# EasyEDA Pro project CirculationPumpSmartControl.eprj

# Schematic Schematic1

## Sheets
1 ESP32: Board Name: Board1; Create Date: 2025-01-20; Page Name: ESP32; Project Name: CirculationPumpSmartControl; Schematic Name: Schematic1; Update Date: 2025-02-27; Company: EasyEDA.com; Page Size: A4; Version: V1.0
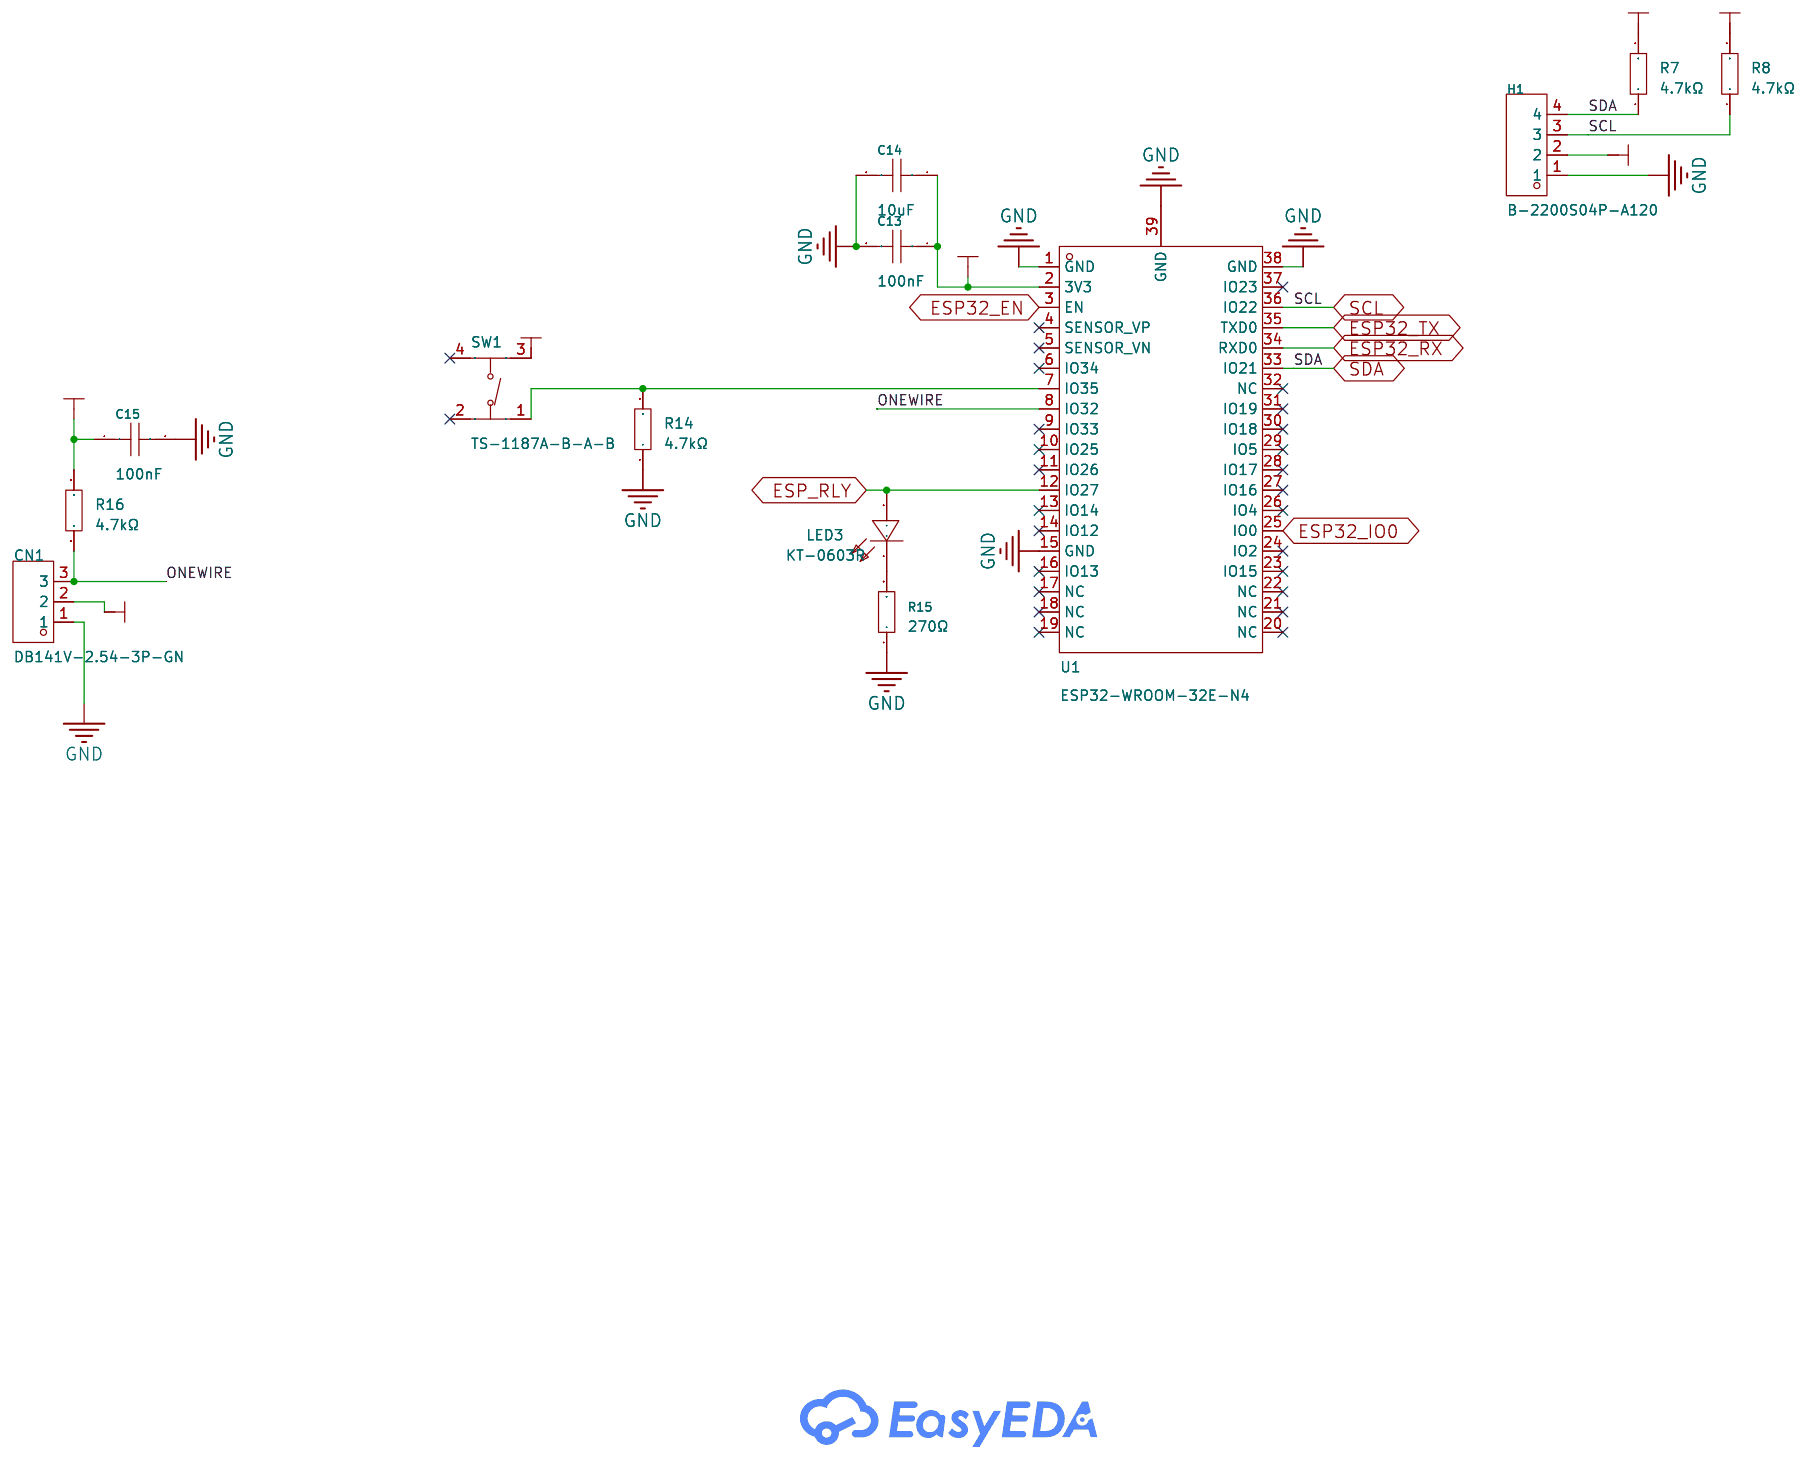
[diagram p0: ESP32]
2 Power: Page Name: Power
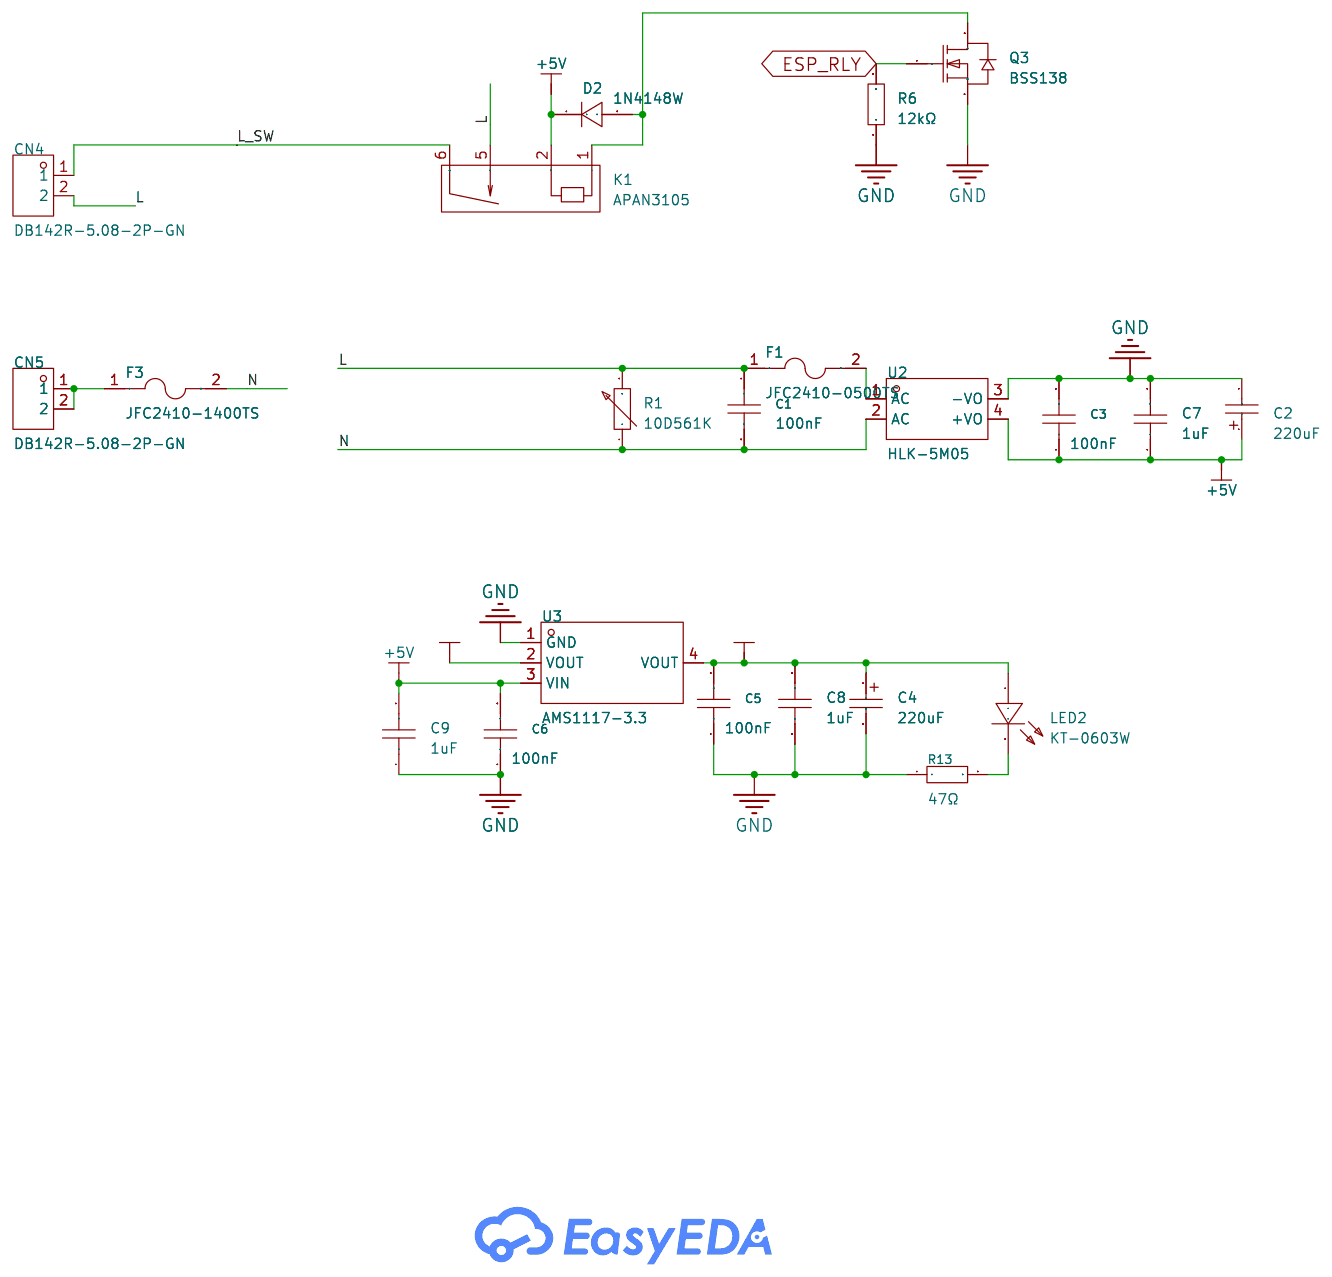
[diagram p1: Power]
3 USB: Page Name: USB; Update Date: 2025-03-05
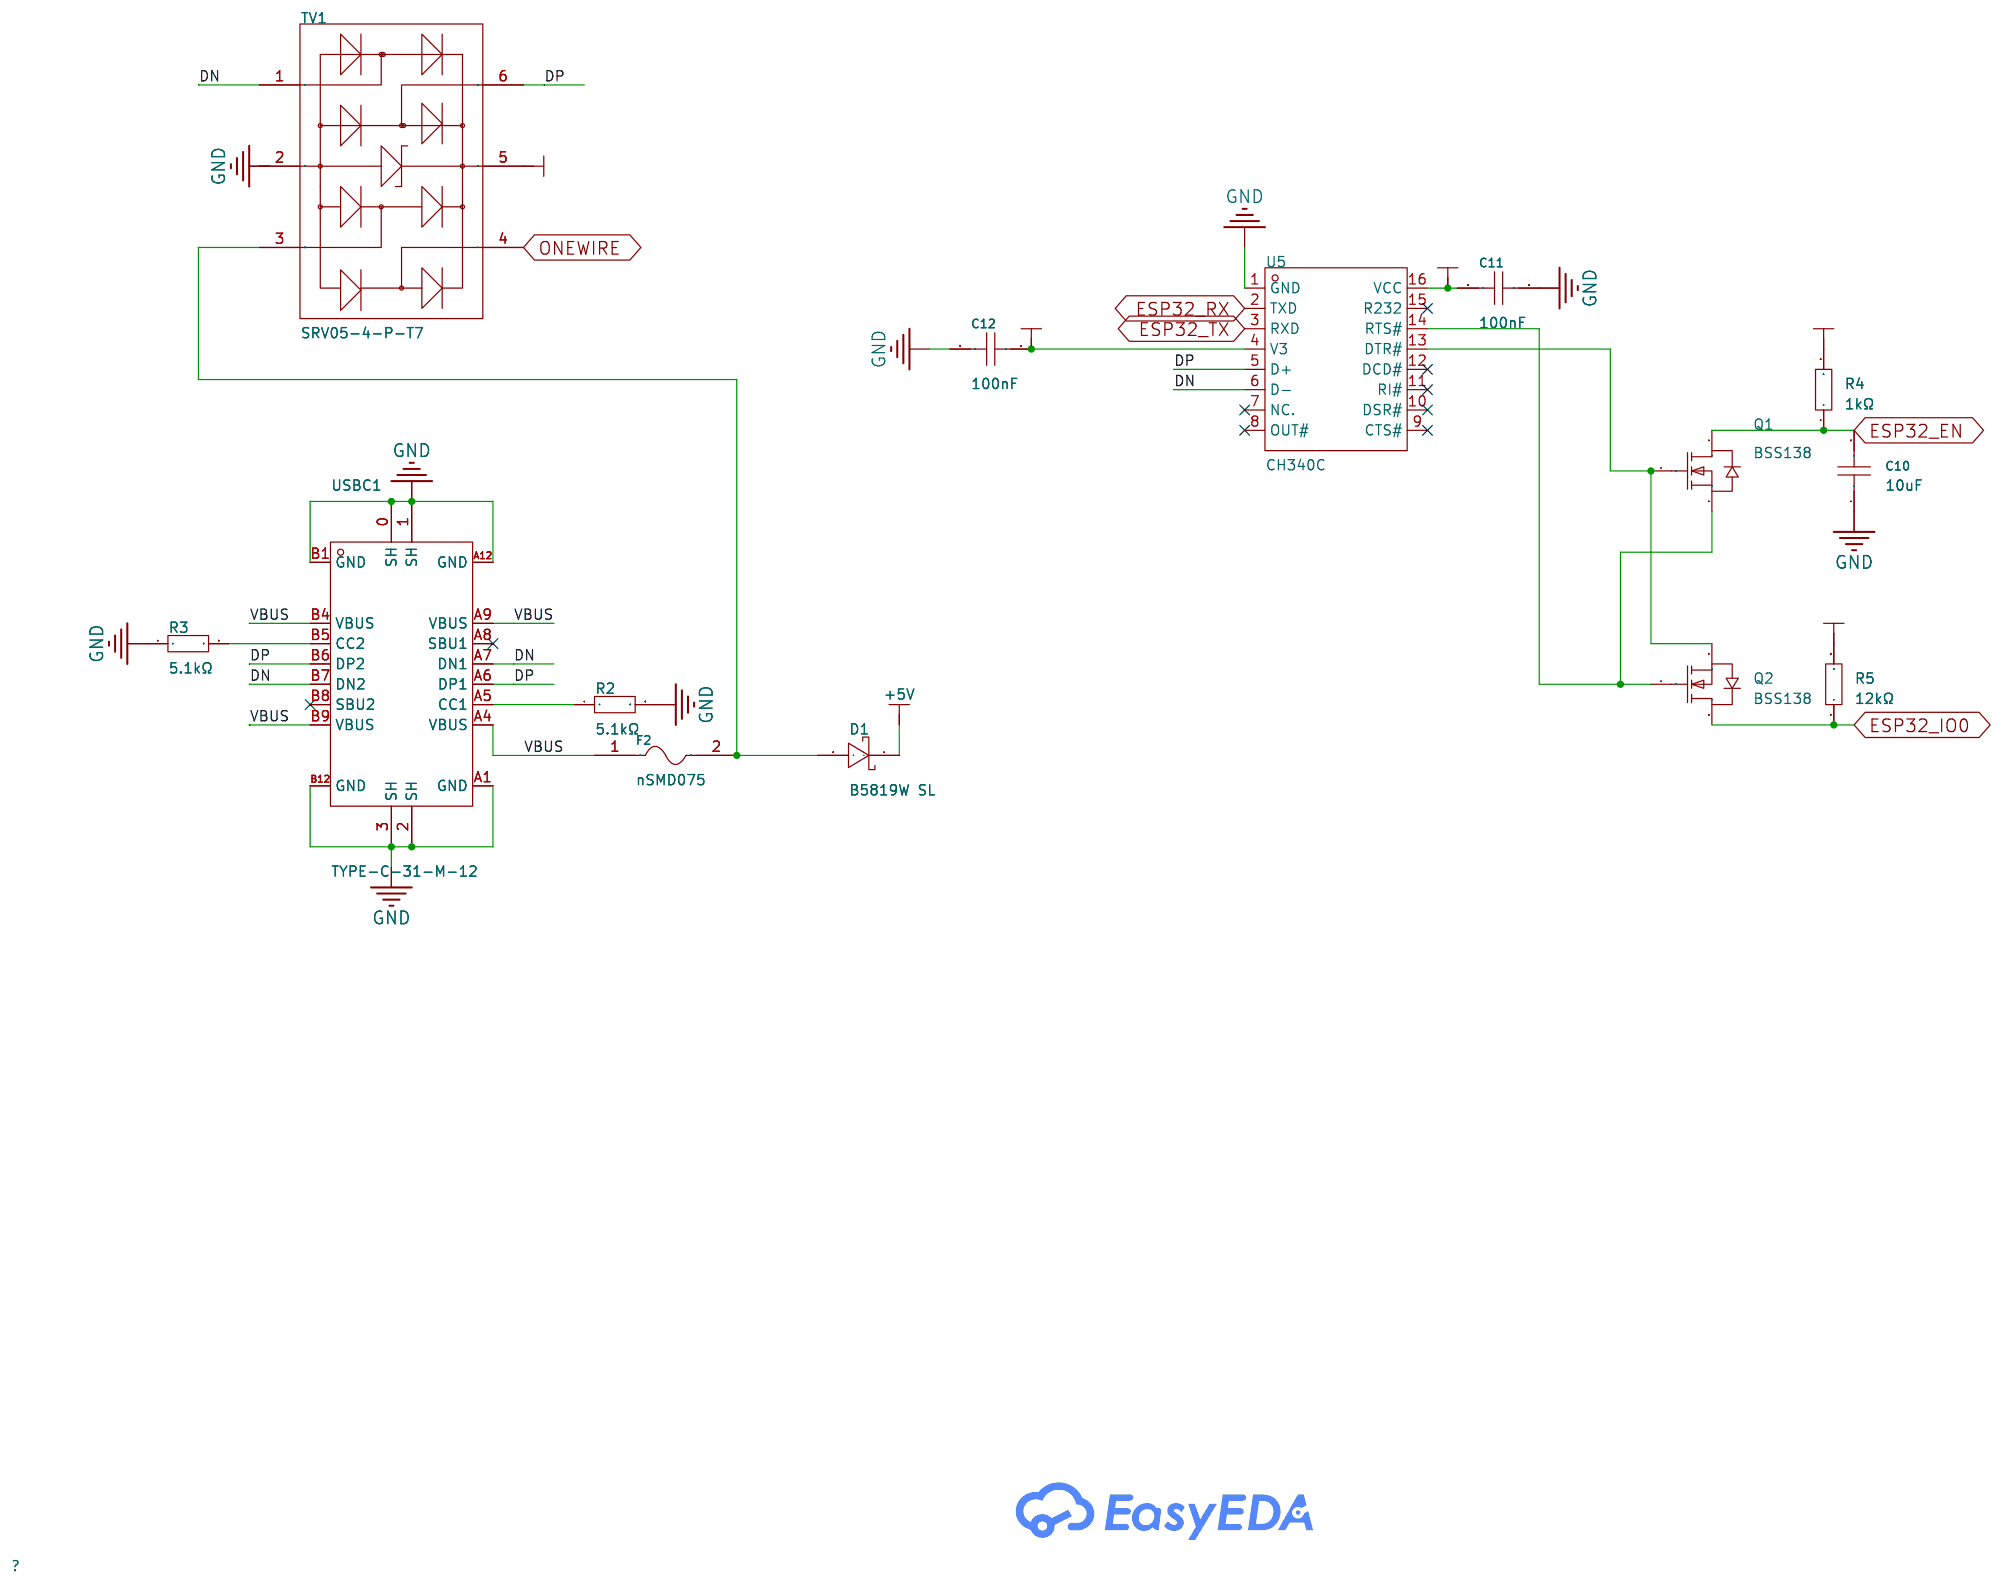
[diagram p2: USB]
4 RTC: Create Date: 2025-02-13; Page Name: RTC; Update Date: 2025-02-13
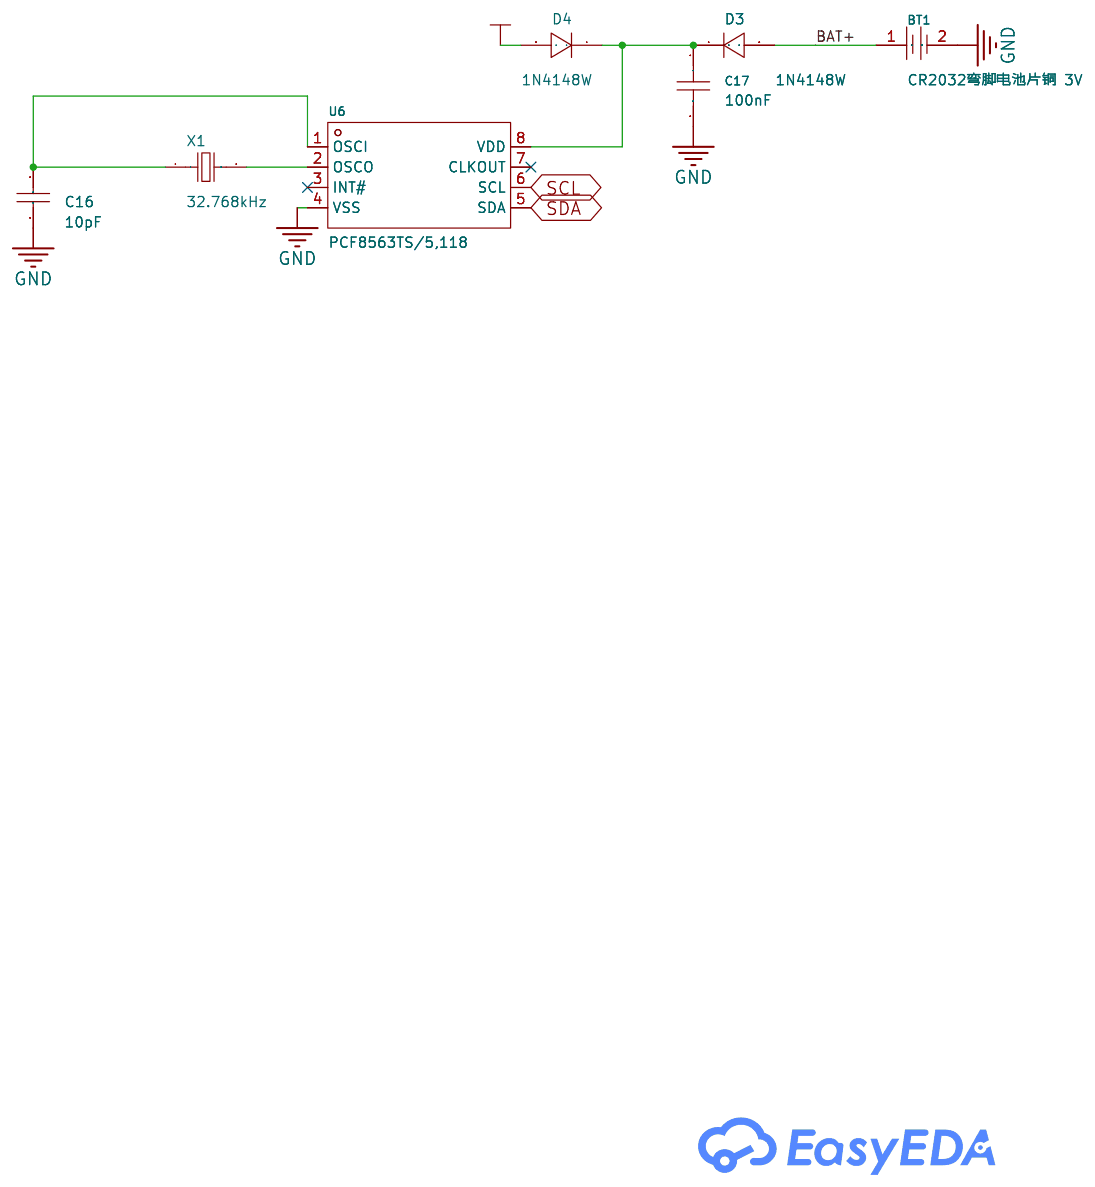
[diagram p3: RTC]

## Parts
sheet ESP32
C13  100nF  [C0603]
C14  10uF  [C0603]
C15  100nF  [C0603]
CN1  DB141V-2.54-3P-GN  [CONN-TH_3P-P2.54_DIBO_DB141V-2.54-3P]
H1  B-2200S04P-A120  [HDR-TH_4P-P2.54-V-F]
LED3  KT-0603R  [LED0603-RD]
R7  4.7kΩ  [R0603]
R8  4.7kΩ  [R0603]
R14  4.7kΩ  [R0603]
R15  270Ω  [R0603]
R16  4.7kΩ  [R0603]
SW1  TS-1187A-B-A-B  [SW-SMD_4P-L5.1-W5.1-P3.70-LS6.5-TL_H1.5]
U1  ESP32-WROOM-32E-N4  [WIFI-SMD_ESP32-WROOM-32E]
sheet Power
C1  100nF  [CAP-TH_L13.0-W6.0-P10.00-D1.0]
C2  220uF  [CASE-B_3528]
C3  100nF  [C0603]
C4  220uF  [CASE-B_3528]
C5  100nF  [C0603]
C6  100nF  [C0603]
C7  1uF  [C0603]
C8  1uF  [C0603]
C9  1uF  [C0603]
CN4  DB142R-5.08-2P-GN  [CONN-TH_2P-P5.08_DIBO_DB142R-5.08-2P]
CN5  DB142R-5.08-2P-GN  [CONN-TH_2P-P5.08_DIBO_DB142R-5.08-2P]
D2  1N4148W  [SOD-123F_L2.7-W1.6-LS3.8-RD]
F1  JFC2410-0500TS  [F2410]
F3  JFC2410-1400TS  [FUSE-SMD_L6.1-W2.6]
K1  APAN3105  [RELAY-TH_PANASONIC_APAN31XX]
LED2  KT-0603W  [LED0603-R-RD_WHITE]
Q3  BSS138  [SOT-23-3_L2.9-W1.6-P1.90-LS2.8-BR]
R1  10D561K  [RES-TH_L13.0-W6.0-P7.50-D0.9-S6.00]
R6  12kΩ  [R0603]
R13  47Ω  [R0603]
U2  HLK-5M05  [PWRM-TH_HLK-5M05]
U3  AMS1117-3.3  [SOT-223-3_L6.5-W3.4-P2.30-LS7.0-BR]
sheet RTC
BT1  CR2032弯脚电池片铜 3V  [BAT-SMD_CR2032-3V]
C16  10pF  [C0603]
C17  100nF  [C0603]
D3  1N4148W  [SOD-123F_L2.7-W1.6-LS3.8-RD]
D4  1N4148W  [SOD-123F_L2.7-W1.6-LS3.8-RD]
U6  PCF8563TS/5,118  [TSSOP-8_L3.0-W3.0-P0.65-LS4.9-BL]
X1  32.768kHz  [FC-135R_L3.2-W1.5]
sheet USB
C10  10uF  [C0603]
C11  100nF  [C0603]
C12  100nF  [C0603]
D1  B5819W SL  [SOD-123_L2.7-W1.6-LS3.7-RD-1]
F2  nSMD075  [F1206]
Q1  BSS138  [SOT-23-3_L2.9-W1.6-P1.90-LS2.8-BR]
Q2  BSS138  [SOT-23-3_L2.9-W1.6-P1.90-LS2.8-BR]
R2  5.1kΩ  [R0603]
R3  5.1kΩ  [R0603]
R4  1kΩ  [R0603]
R5  12kΩ  [R0603]
TV1  SRV05-4-P-T7  [SOT-23-6_L2.9-W1.6-P0.95-LS2.8-BR]
U5  CH340C  [SOP-16_L10.0-W3.9-P1.27-LS6.0-BL]
USBC1  TYPE-C-31-M-12  [USB-C_SMD-TYPE-C-31-M-12]

## Library data of the parts
C3 C5 C6 C11-C13 C15 C17 = CC0603KRX7R9BB104: LCSC Part Name: 100nF ±10% 50V; Supplier Part: C14663; Manufacturer: YAGEO(国巨); Supplier Footprint: 0603; JLCPCB Part Class: Basic Part; Datasheet: https://atta.szlcsc.com/upload/public/pdf/source/20180910/C282072_33301C7F631E79921B82A8DAC6BCC5B3.pdf; Supplier: LCSC; Tolerance: ±10%
C10 C14 = CL10A106KP8NNNC: LCSC Part Name: 10uF ±10% 10V; Supplier Part: C19702; Manufacturer: SAMSUNG(三星); Supplier Footprint: 0603; JLCPCB Part Class: Basic Part; Datasheet: https://atta.szlcsc.com/upload/public/pdf/source/20160218/1457707763339.pdf; Supplier: LCSC; Tolerance: ±10%
CN1 = DB141V-2.54-3P-GN: LCSC Part Name: 1x3P 2.54mm 每排P数:3 排数:1; Supplier Part: C2898745; Manufacturer: DORABO(地博电气); Supplier Footprint: 插件,P=2.54mm; JLCPCB Part Class: Extended Part; Datasheet: https://atta.szlcsc.com/upload/public/pdf/source/20230718/84EEC4A0E3A493EDAEC1F3C97EE92B94.pdf; Supplier: LCSC; Structure: 1x3P; Pitch: 2.54mm; Color: Green; Number of Pins: 3P; Number of PINs Per Row: 3; Current Rating (Max): 6A; Voltage Rating (Max): 130V; Wire Gauge - AWG: 20~24; Wire Gauge - mm2: 0.2~1; Operating Temperature Range: -40℃~+105℃; Number of Rows: 1
H1 = B-2200S04P-A120: LCSC Part Name: 间距:2.54mm 1x4P 直插; Supplier Part: C124413; Manufacturer: Ckmtw(灿科盟); Supplier Footprint: 插件,P=2.54mm; JLCPCB Part Class: Extended Part; Datasheet: https://atta.szlcsc.com/upload/public/pdf/source/20170821/C124418_1503303326113901572.pdf; Supplier: LCSC; Holes Structure: 1x4P; Pitch: 2.54mm; Mounting Type: Straight; Number of Rows: Plugin; Number of Holes: 4P; Contact Material: Brass
LED3 = KT-0603R: LCSC Part Name: 0603 红灯 高亮; Supplier Part: C2286; Manufacturer: KENTO; Supplier Footprint: 0603; JLCPCB Part Class: Basic Part; Datasheet: https://atta.szlcsc.com/upload/public/pdf/source/20160616/1466072038404.pdf; Supplier: LCSC; Emitted Color: Red; Operating Temperature: -40℃~+85℃
R7 R8 R14 R16 = 0603WAF4701T5E: LCSC Part Name: 4.7kΩ ±1% 100mW 厚膜电阻; Supplier Part: C23162; Manufacturer: UNI-ROYAL(厚声); Supplier Footprint: 0603; JLCPCB Part Class: Basic Part; Datasheet: https://atta.szlcsc.com/upload/public/pdf/source/20200306/C422600_1E6D84923E4A46A82E41ADD87F860B5C.pdf; Supplier: LCSC; Type: Thick Film Resistors; Tolerance: ±1%; Temperature Coefficient: ±100ppm/℃; Operating Temperature Range: -55℃~+155℃
R15 = 0603WAF2700T5E: LCSC Part Name: 270Ω ±1% 100mW 厚膜电阻; Supplier Part: C22966; Manufacturer: UNI-ROYAL(厚声); Supplier Footprint: 0603; JLCPCB Part Class: Basic Part; Datasheet: https://atta.szlcsc.com/upload/public/pdf/source/20200306/C422600_1E6D84923E4A46A82E41ADD87F860B5C.pdf; Supplier: LCSC; Type: Thick Film Resistors; Tolerance: ±1%; Temperature Coefficient: ±100ppm/℃; Operating Temperature Range: -55℃~+155℃
SW1 = TS-1187A-B-A-B: LCSC Part Name: 5.1*5.1*1.5mm 立贴 轻触开关; Supplier Part: C318884; Manufacturer: XKB Connectivity(中国星坤); Supplier Footprint: SMD; JLCPCB Part Class: Basic Part; Datasheet: https://atta.szlcsc.com/upload/public/pdf/source/20200227/C318890_053E50208A88A7BA1965D8746000774E.pdf; Supplier: LCSC; Circuit: SPST; Actuator Style: Round Button; Operating Force: 160gf; Mounting Style: Brick nogging; Switch Length: 5.1mm; Switch Width: 5.1mm; Switch Height: 1.5mm; Strike Gundam: 不带; Contact Current: 50mA; Voltage Rating (DC): 12V; Actuator/Cap Color: 金色; With Lamp: No; Mechanical Life: 10万次; Operating Temperature: -30℃~+85℃
U1 = ESP32-WROOM-32E-N4: LCSC Part Name: 通用型Wi-Fi+BT+BLE MCU模组; Supplier Part: C701341; Manufacturer: ESPRESSIF(乐鑫); Supplier Footprint: SMD,18x25.5mm; JLCPCB Part Class: Extended Part; Datasheet: https://atta.szlcsc.com/upload/public/pdf/source/20220601/0020821B65DE5740BBACA5FACC5CF3B6.pdf; Supplier: LCSC
C1 = MP2104K27C3X6LC: LCSC Part Name: 100nF ±10% 275V 等级:X2; Supplier Part: C105759; Manufacturer: SRD(圣融达); Supplier Footprint: 插件,P=10mm; JLCPCB Part Class: Extended Part; Datasheet: https://atta.szlcsc.com/upload/public/pdf/source/20211112/28AD7BCA5F9A6D19E46F5213448E69C0.pdf; Supplier: LCSC; Tolerance: ±10%; Voltage(AC): 275V; safety certification: UL；ENEC；VDE；CQC；CSA
C2 C4 = TLJB227M006R0500: LCSC Part Name: 220uF ±20% 6.3V; Supplier Part: C30242; Manufacturer: Kyocera AVX; Supplier Footprint: CASE-B-3528-21(mm); JLCPCB Part Class: Extended Part; Datasheet: https://atta.szlcsc.com/upload/public/pdf/source/20181016/C313517_95E099C94D57B8A6005DAF15C3058A23.pdf; Supplier: LCSC; Tolerance: ±20%; Equivalent Series Resistance(ESR): 500mΩ@100kHz; Operating Temperature: -55℃~+125℃
C7-C9 = CL10A105KB8NNNC: LCSC Part Name: 1uF ±10% 50V; Supplier Part: C15849; Manufacturer: SAMSUNG(三星); Supplier Footprint: 0603; JLCPCB Part Class: Basic Part; Datasheet: https://atta.szlcsc.com/upload/public/pdf/source/20160218/1457707763339.pdf; Supplier: LCSC; Tolerance: ±10%
CN4 CN5 = DB142R-5.08-2P-GN: LCSC Part Name: 1x2P 5.08mm 每排P数:2 排数:1; Supplier Part: C2898709; Manufacturer: DORABO(地博电气); Supplier Footprint: 弯插,P=5.08mm; JLCPCB Part Class: Extended Part; Datasheet: https://atta.szlcsc.com/upload/public/pdf/source/20230627/D44C7807FE032969C21692DA46FBD086.pdf; Supplier: LCSC; Structure: 1x2P; Pitch: 5.08mm; Color: Green; Number of Pins: 2P; Number of PINs Per Row: 2; Current Rating (Max): 15A; Voltage Rating (Max): 250V; Wire Gauge - AWG: 16~22; Wire Gauge - mm2: 0.2~1.5; Operating Temperature Range: -40℃~+105℃; Number of Rows: 1
D2-D4 = 1N4148W_C81598: Supplier Part: C81598; Manufacturer: ST(先科); Supplier Footprint: SOD-123; JLCPCB Part Class: Basic Part; Datasheet: https://atta.szlcsc.com/upload/public/pdf/source/20161024/1477288446905.pdf; Supplier: LCSC; Diode Configuration: Independent Type; Forward Voltage (Vf@If): 1V@50mA; Reverse Leakage Current (Ir): 1uA@75V
F1 = JFC2410-0500TS: LCSC Part Name: 250V贴片式保险丝; Supplier Part: C136377; Manufacturer: JDTfuse(集电通); Supplier Footprint: SMD; JLCPCB Part Class: Extended Part; Datasheet: https://atta.szlcsc.com/upload/public/pdf/source/20230515/1D43BDD82FA89335B41B370141760CD9.pdf; Supplier: LCSC; Type: SMD Fuse; Current Rating: 500mA; Voltage Rating  (AC): 250V; Voltage Rating (DC): 250V; Operating Temperature: -55℃~+125℃; Breaking Capacity: 50A
F3 = JFC2410-1400TS: LCSC Part Name: 250V贴片式保险丝; Supplier Part: C136386; Manufacturer: JDTfuse(集电通); Supplier Footprint: SMD; JLCPCB Part Class: Extended Part; Datasheet: https://atta.szlcsc.com/upload/public/pdf/source/20171023/C136393_15087481231271053527.pdf; Supplier: LCSC; Type: SMD Fuse; Current Rating: 4A; Voltage Rating  (AC): 250V; Voltage Rating (DC): 250V; Operating Temperature: -55℃~+125℃; Breaking Capacity: 50A
K1 = APAN3105: Supplier Part: C90227; Manufacturer: PANASONIC(松下); Supplier Footprint: SIP,5x20mm; JLCPCB Part Class: Extended Part; Datasheet: https://atta.szlcsc.com/upload/public/pdf/source/20161217/1481939214072.pdf; Supplier: LCSC; Coil Voltage: 5V; Contact Form: One Normally Open: 1A (SPST-NO); Maximum Switching Voltage: 250V@AC；110V@DC; Contact Material: AgNi+Gold plating; Maximum Switching Current: 5A; Operate Time: 10ms; Release Time: 5ms; Operating Temperature: -40℃~+90℃
LED2 = KT-0603W: LCSC Part Name: 0603 白灯 高亮; Supplier Part: C2290; Manufacturer: KENTO; Supplier Footprint: 0603; JLCPCB Part Class: Basic Part; Datasheet: https://atta.szlcsc.com/upload/public/pdf/source/20221101/4C23D5C85BA051E44A00B833D0A41468.pdf; Supplier: LCSC; Emitted Color: White
Q1-Q3 = BSS138_C112239: LCSC Part Name: 1个N沟道 耐压:50V 电流:220mA; Supplier Part: C112239; Manufacturer: SHIKUES(时科); Supplier Footprint: SOT-23; JLCPCB Part Class: Extended Part; Datasheet: https://atta.szlcsc.com/upload/public/pdf/source/20170720/1500524147280.pdf; Supplier: LCSC; Type: 1 N-Channel; Drain Source On Resistance (RDS(on)@Vgs,Id): 3.5Ω@10V,220mA; Gate Threshold Voltage (Vgs(th)@Id): 1.5V@1mA
R1 = 10D561K_C113236: LCSC Part Name: 钳位电压920V 42.3焦耳 插件压敏电阻; Supplier Part: C113236; Manufacturer: HEL(鸿志); Supplier Footprint: 插件; JLCPCB Part Class: Extended Part; Datasheet: https://atta.szlcsc.com/upload/public/pdf/source/20171026/C136820_15089842275381059197.pdf; Supplier: LCSC; Varistor Voltage: 504V~616V; Maximum Energy: 42.3J; Typical Capatitance: 180pF@1kHz
R5 R6 = 0603WAF1202T5E: LCSC Part Name: 12kΩ ±1% 100mW 厚膜电阻; Supplier Part: C22790; Manufacturer: UNI-ROYAL(厚声); Supplier Footprint: 0603; JLCPCB Part Class: Basic Part; Datasheet: https://atta.szlcsc.com/upload/public/pdf/source/20200306/C422600_1E6D84923E4A46A82E41ADD87F860B5C.pdf; Supplier: LCSC; Type: Thick Film Resistors; Tolerance: ±1%; Temperature Coefficient: ±100ppm/℃; Operating Temperature Range: -55℃~+155℃
R13 = 0603WAF470JT5E: LCSC Part Name: 47Ω ±1% 100mW 厚膜电阻; Supplier Part: C23182; Manufacturer: UNI-ROYAL(厚声); Supplier Footprint: 0603; JLCPCB Part Class: Basic Part; Datasheet: https://atta.szlcsc.com/upload/public/pdf/source/20200306/C422600_1E6D84923E4A46A82E41ADD87F860B5C.pdf; Supplier: LCSC; Type: Thick Film Resistors; Tolerance: ±1%; Temperature Coefficient: ±100ppm/℃; Operating Temperature Range: -55℃~+155℃
U2 = HLK-5M05_C209907: Supplier Part: C209907; Manufacturer: HI-LINK(海凌科); Supplier Footprint: 插件; JLCPCB Part Class: Extended Part; Datasheet: https://atta.szlcsc.com/upload/public/pdf/source/20221201/2BCA712152932936C3B48F57332AB96D.pdf; Supplier: LCSC
U3 = AMS1117-3.3_C6186: LCSC Part Name: 输出3.3V 1A; Supplier Part: C6186; Manufacturer: AMS; Supplier Footprint: SOT-223; JLCPCB Part Class: Basic Part; Datasheet: https://atta.szlcsc.com/upload/public/pdf/source/20180727/C6186_7A095716F0823C02F1997A905E26C086.pdf; Supplier: LCSC; Output Voltage: 3.3V; MAX Output Current: 1A; Power Supply Rejection Ratio (PSRR): 72dB@(120Hz); Dropout Voltage: 1.3V@(800mA); Output Polarity: Positive electrode; Number of Outputs: 1
BT1 = CR2032弯脚电池片铜 3V: Supplier Part: C70373; Manufacturer: Q&J; Supplier Footprint: SMD; JLCPCB Part Class: Extended Part; Datasheet: https://atta.szlcsc.com/upload/public/pdf/source/20160427/1461725216470.pdf; Supplier: LCSC; Connector Type: Battery button; Battery Type: CR2032
C16 = CL10C100JB8NNNC: LCSC Part Name: 10pF ±5% 50V; Supplier Part: C1634; Manufacturer: SAMSUNG(三星); Supplier Footprint: 0603; JLCPCB Part Class: Basic Part; Datasheet: https://atta.szlcsc.com/upload/public/pdf/source/20160218/1457707763339.pdf; Supplier: LCSC; Tolerance: ±5%
U6 = PCF8563TS/5,118: Supplier Part: C27397; Manufacturer: NXP(恩智浦); Supplier Footprint: TSSOP-8-3.0mm; JLCPCB Part Class: Extended Part; Datasheet: https://atta.szlcsc.com/upload/public/pdf/source/20140314/1457707017287.pdf; Supplier: LCSC; Interface: I2C; Operating Voltage: 1.8V~5.5V
X1 = Q13FC13500004_C32346: LCSC Part Name: 32.768kHz ±20ppm 12.5pF; Supplier Part: C32346; Manufacturer: EPSON(爱普生); Manufacturer Part: Q13FC13500004; Supplier Footprint: SMD3215-2P; JLCPCB Part Class: Basic Part; Datasheet: https://atta.szlcsc.com/upload/public/pdf/source/20240418/0E0FF5F0356BA3753F616001439D1416.pdf; Supplier: LCSC; Crystal Type: Surface Mount Crystal; Normal temperature Frequency Tolerance: ±20ppm; Equivalent Series Resistance (ESR): 70kΩ
D1 = B5819W SL: LCSC Part Name: 电压:40V 电流:1A; Supplier Part: C8598; Manufacturer: CJ(江苏长电/长晶); Supplier Footprint: SOD-123; JLCPCB Part Class: Basic Part; Datasheet: https://atta.szlcsc.com/upload/public/pdf/source/20171228/C164911_15144413243851213914.pdf; Supplier: LCSC; Forward Voltage (Vf@If): 600mV@1A; Reverse Voltage (Vr): 40V; Rectified Current: 1A
F2 = nSMD075_C70078: LCSC Part Name: 6V 750mA 1206自恢复; Supplier Part: C70078; Manufacturer: 台湾陆海; Supplier Footprint: 1206; JLCPCB Part Class: Extended Part; Datasheet: https://atta.szlcsc.com/upload/public/pdf/source/20160331/1459396376533.pdf; Supplier: LCSC; Operating Voltage (Max): 6V; Current Rating (Max): 100A; Hold Current: 750mA; Trip Current: 1.5A
R2 R3 = 0603WAF5101T5E: LCSC Part Name: 5.1kΩ ±1% 100mW 厚膜电阻; Supplier Part: C23186; Manufacturer: UNI-ROYAL(厚声); Supplier Footprint: 0603; JLCPCB Part Class: Basic Part; Datasheet: https://atta.szlcsc.com/upload/public/pdf/source/20200306/C422600_1E6D84923E4A46A82E41ADD87F860B5C.pdf; Supplier: LCSC; Type: Thick Film Resistors; Tolerance: ±1%; Temperature Coefficient: ±100ppm/℃; Operating Temperature Range: -55℃~+155℃
R4 = 0603WAF1001T5E: LCSC Part Name: 1kΩ ±1% 100mW 厚膜电阻; Supplier Part: C21190; Manufacturer: UNI-ROYAL(厚声); Supplier Footprint: 0603; JLCPCB Part Class: Basic Part; Datasheet: https://atta.szlcsc.com/upload/public/pdf/source/20200306/C422600_1E6D84923E4A46A82E41ADD87F860B5C.pdf; Supplier: LCSC; Type: Thick Film Resistors; Tolerance: ±1%; Temperature Coefficient: ±100ppm/℃; Operating Temperature Range: -55℃~+155℃
TV1 = SRV05-4-P-T7_C85364: Supplier Part: C85364; Manufacturer: PROTEK; Supplier Footprint: SOT-23-6; JLCPCB Part Class: Extended Part; Datasheet: https://atta.szlcsc.com/upload/public/pdf/source/20161024/1477288764689.pdf; Supplier: LCSC; Reverse Stand-Off Voltage (Vrwm): 5V; Maximum Clamping Voltage: 12V; Peak Pulse Current (Ipp)@10/1000us: 1A@8/20us; Breakdown Voltage: 6V; Type: TVS
U5 = CH340C: LCSC Part Name: CH340C USB转串口芯片 CH340; Supplier Part: C84681; Manufacturer: WCH(南京沁恒); Supplier Footprint: SOP-16; JLCPCB Part Class: Extended Part; Datasheet: https://atta.szlcsc.com/upload/public/pdf/source/20240619/63986D8440D4E5267A77ACD891CC4DE3.pdf; Supplier: LCSC; Applications Function: Transceiver; Supply Voltage: 3.3V；5V; Data Rate: 2Mbps
USBC1 = TYPE-C-31-M-12: LCSC Part Name: Type-C 母; Supplier Part: C165948; Manufacturer: 韩国韩荣; Supplier Footprint: SMD; JLCPCB Part Class: Extended Part; Datasheet: https://atta.szlcsc.com/upload/public/pdf/source/20220525/466408E853115E789EDB0DDC29077C05.pdf; Supplier: LCSC; Connector Type: Type-C; Gender: Female; Number of Contacts: 16P; Number of Ports: 1; Current Rating - Power (Max): 5A

## Nets
+3V3: C4.1 C5.2 C8.2 C11.2 C12.1 C13.1 C14.1 C15.1 CN1.2 D4.2(A) H1.2 LED2.1(A) R4.2 R5.2 R7.2 R8.2 R16.2 SW1.3(C) TV1.5 U1.2(3V3) U3.2(VOUT) U3.4(VOUT) U5.4(V3) U5.16(VCC)
+5V: C2.1 C3.1 C6.2 C7.1 C9.2 D1.1(-) D2.1(K) K1.2 U2.4(+VO) U3.3(VIN)
GND: BT1.2 C2.2 C3.2 C4.2 C5.1 C6.1 C7.2 C8.1 C9.1 C10.1 C11.1 C12.2 C13.2 C14.2 C15.2 C16.1 C17.2 CN1.1 H1.1 Q3.2(S) R2.2 R3.1 R6.1 R13.1 R14.1 R15.1 TV1.2 U1.1(GND) U1.15(GND) U1.38(GND) U1.39(GND) U2.3(-VO) U3.1(GND) U5.1(GND) U6.4(VSS) USBC1.0(SH) USBC1.1(SH) USBC1.2(SH) USBC1.3(SH) USBC1.A1(GND) USBC1.A12(GND) USBC1.B1(GND) USBC1.B12(GND)
VBUS: F2.1 USBC1.A4(VBUS) USBC1.A9(VBUS) USBC1.B4(VBUS) USBC1.B9(VBUS)
BAT+: BT1.1 D3.2(A)
DN: TV1.1 U5.6(D-) USBC1.A7(DN1) USBC1.B7(DN2)
DP: TV1.6 U5.5(D+) USBC1.A6(DP1) USBC1.B6(DP2)
ESP32_EN: C10.2 Q1.3(D) R4.1 U1.3(EN)
ESP32_IO0: Q2.3(D) R5.1 U1.25(IO0)
ESP32_RX: U1.34(RXD0) U5.2(TXD)
ESP32_TX: U1.35(TXD0) U5.3(RXD)
ESP_RLY: LED3.2(A) Q3.1(G) R6.2 U1.12(IO27)
L: C1.1 CN4.2 F1.1 K1.5(ON) R1.2
L_SW: CN4.1 K1.6(COM)
N: C1.2 F3.2 R1.1 U2.2(AC)
ONEWIRE: CN1.3 R16.1 TV1.4 U1.8(IO32)
SCL: H1.3 R8.1 U1.36(IO22) U6.6(SCL)
SDA: H1.4 R7.1 U1.33(IO21) U6.5(SDA)
$1N2483: R14.2 SW1.1(A) U1.7(IO35)
$1N2665: LED3.1(K) R15.2
$2N1901: D2.2(A) K1.1 Q3.3(D)
$2N2254: LED2.2(K) R13.2
$2N4343: CN5.1 CN5.2 F3.1
$2N4365: F1.2 U2.1(AC)
$3N1120: D1.2(+) F2.2 TV1.3
$3N1265: R3.2 USBC1.B5(CC2)
$3N1271: R2.1 USBC1.A5(CC1)
$3N1441: Q1.1(G) Q2.2(S) U5.13(DTR#)
$3N1446: Q1.2(S) Q2.1(G) U5.14(RTS#)
$4N445: U6.2(OSCO) X1.2
$4N449: C16.2 U6.1(OSCI) X1.1
$4N609: C17.1 D3.1(K) D4.1(K) U6.8(VDD)

Not connected (* = marked no-connect by the designer): SW1 2(B)* 4(D)*; U1 4(SENSOR_VP)* 5(SENSOR_VN)* 6(IO34)* 9(IO33)* 10(IO25)* 11(IO26)* 13(IO14)* 14(IO12)* 16(IO13)* 17(NC)* 18(NC)* 19(NC)* 20(NC)* 21(NC)* 22(NC)* 23(IO15)* 24(IO2)* 26(IO4)* 27(IO16)* 28(IO17)* 29(IO5)* 30(IO18)* 31(IO19)* 32(NC)* 37(IO23)*; U5 7(NC.)* 8(OUT#)* 9(CTS#)* 10(DSR#)* 11(RI#)* 12(DCD#)* 15(R232)*; U6 3(INT#)* 7(CLKOUT)*; USBC1 A8(SBU1)* B8(SBU2)*

# Board PCB1
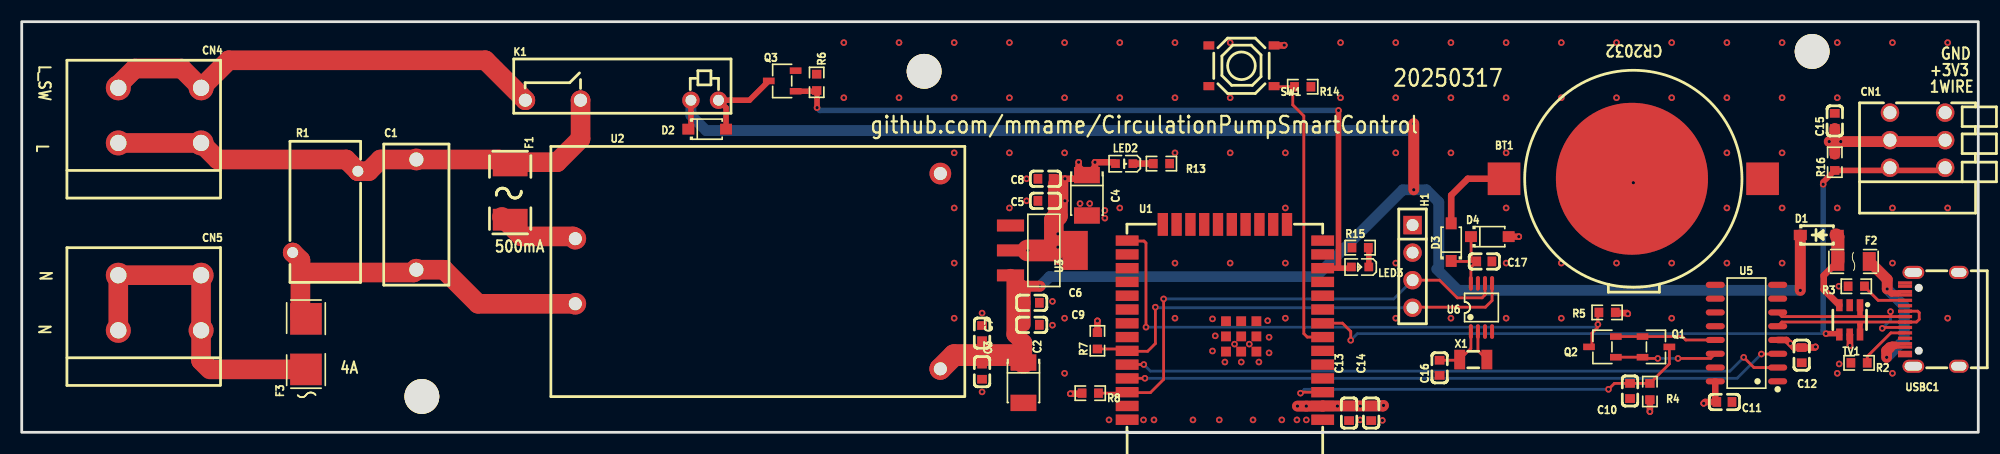
[diagram p4: board, top side]
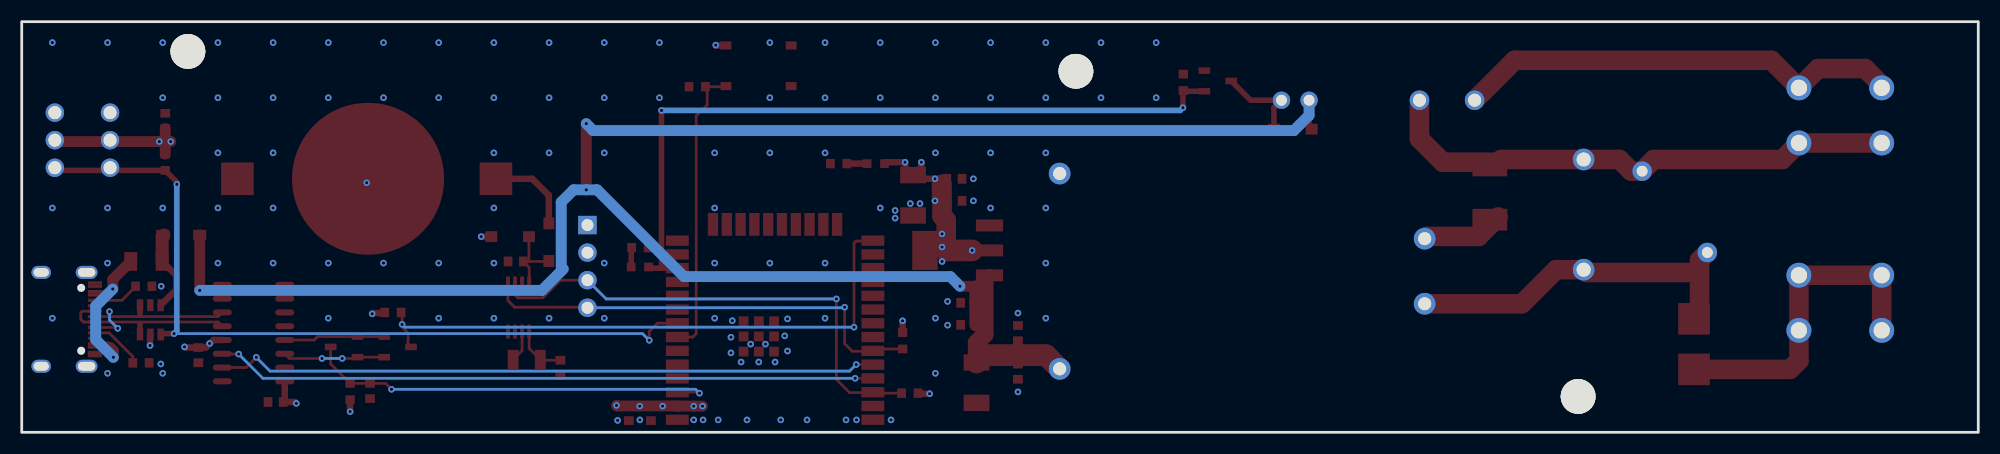
[diagram p5: board, bottom side, seen from below]

Outline 180.09 x 37.85 mm; copper layers: Top Layer, Inner1, Inner2, Bottom Layer. Coordinates in mm from the lower left corner of the outline.
Outline path: rectangle 0,37.85 180.09,0
Stack: Top Layer 0.035mm Outer layer thickness 1oz / Dielectric1 0.2104mm 7628 RC49% 8.6mil / Inner1 0.0152mm Inner layer thickness / Dielectric2 1.065mm 1.1mm H/HOZ Copper / Inner2 0.0152mm Inner layer thickness / Dielectric3 0.2104mm 7628 RC49% 8.6mil / Bottom Layer 0.035mm Outer layer thickness 1oz

## Design rules (mm)
template: JLCPCB Capability(Multiple Layers Board)
spacing copperThickness1oz (default): track to track 0.102, other pairs 0.152 to 0.3
spacing copperThickness2oz: track to track 0.203, other pairs 0.152 to 0.3
spacing copperThicknessInner0.5oz: track to track 0.089, other pairs 0.152 to 0.3
track width copperThickness1oz (default): min 0.102, default 0.254, max 2.54
track width copperThickness2oz: min 0.203, default 0.254, max 2.54
track width copperThickness0.5oz: min 0.089, default 0.254, max 2.54
differential pair differentialPair (default): width min 0.127, default 0.254, max 2.54; gap min 0.152, default 0.152
via viaSize (default): diameter min 0.3, default 0.61, max 10; hole min 0.2, default 0.305, max 6.3

## Placement (name value [footprint] x y rotation side)
BT1  CR2032弯脚电池片铜 3V  [BAT-SMD_CR2032-3V]  148.34 23.37 90 top
C1  100nF  [CAP-TH_L13.0-W6.0-P10.00-D1.0]  36.32 20.07 270 top
C2  220uF  [CASE-B_3528]  92.2 4.57 270 top
C3  100nF  [C0603]  88.39 5.59 270 top
C4  220uF  [CASE-B_3528]  98.04 21.84 270 top
C5  100nF  [C0603]  94.23 21.34 0 top
C6  100nF  [C0603]  92.96 11.94 180 top
C7  1uF  [C0603]  88.39 9.14 90 top
C8  1uF  [C0603]  94.23 23.37 0 top
C9  1uF  [C0603]  92.96 9.91 180 top
C10  10uF  [C0603]  148.03 3.81 90 top
C11  100nF  [C0603]  156.72 2.79 180 top
C12  100nF  [C0603]  163.83 7.11 270 top
C13  100nF  [C0603]  122.17 1.78 270 top
C14  10uF  [C0603]  124.21 1.78 270 top
C15  100nF  [C0603]  166.88 28.7 90 top
C16  10pF  [C0603]  130.5 5.94 90 top
C17  100nF  [C0603]  134.62 15.75 0 top
CN1  DB141V-2.54-3P-GN  [CONN-TH_3P-P2.54_DIBO_DB141V-2.54-3P]  174.5 26.92 270 top
CN4  DB142R-5.08-2P-GN  [CONN-TH_2P-P5.08_DIBO_DB142R-5.08-2P]  12.7 29.21 270 top
CN5  DB142R-5.08-2P-GN  [CONN-TH_2P-P5.08_DIBO_DB142R-5.08-2P]  12.7 11.94 270 top
D1  B5819W SL  [SOD-123_L2.7-W1.6-LS3.7-RD-1]  165.41 18.19 0 top
D2  1N4148W  [SOD-123F_L2.7-W1.6-LS3.8-RD]  63.09 27.94 0 top
D3  1N4148W  [SOD-123F_L2.7-W1.6-LS3.8-RD]  131.57 17.53 90 top
D4  1N4148W  [SOD-123F_L2.7-W1.6-LS3.8-RD]  135.13 18.03 0 top
F1  JFC2410-0500TS  [F2410]  44.96 22.1 270 top
F2  nSMD075  [F1206]  168.61 15.75 180 top
F3  JFC2410-1400TS  [FUSE-SMD_L6.1-W2.6]  26.16 8.13 90 top
H1  B-2200S04P-A120  [HDR-TH_4P-P2.54-V-F]  128.02 15.29 270 top
K1  APAN3105  [RELAY-TH_PANASONIC_APAN31XX]  55.24 30.61 0 top
LED2  KT-0603W  [LED0603-R-RD_WHITE]  101.47 24.77 180 top
LED3  KT-0603R  [LED0603-RD]  123.19 15.24 180 top
NOREF  -  [Pad_e74]  36.83 3.3 0 top
NOREF#2  -  [Pad_e85]  164.8 35.1 0 top
NOREF#3  -  [Pad_e1177]  83.06 33.27 0 top
Q1  BSS138  [SOT-23-3_L2.9-W1.6-P1.90-LS2.8-BR]  150.42 7.87 180 top
Q2  BSS138  [SOT-23-3_L2.9-W1.6-P1.90-LS2.8-BR]  145.49 7.87 0 top
Q3  BSS138  [SOT-23-3_L2.9-W1.6-P1.90-LS2.8-BR]  69.99 32.38 0 top
R1  10D561K  [RES-TH_L13.0-W6.0-P7.50-D0.9-S6.00]  27.94 20.32 90 top
R2  5.1kΩ  [R0603]  169.11 6.4 180 top
R3  5.1kΩ  [R0603]  168.86 13.46 0 top
R4  1kΩ  [R0603]  149.86 3.76 270 top
R5  12kΩ  [R0603]  145.92 11.05 0 top
R6  12kΩ  [R0603]  73.17 32.26 270 top
R7  4.7kΩ  [R0603]  99.01 8.43 90 top
R8  4.7kΩ  [R0603]  98.35 3.61 180 top
R13  47Ω  [R0603]  104.9 24.77 180 top
R14  4.7kΩ  [R0603]  117.91 31.85 180 top
R15  270Ω  [R0603]  123.19 17.02 0 top
R16  4.7kΩ  [R0603]  166.88 24.89 90 top
SW1  TS-1187A-B-A-B  [SW-SMD_4P-L5.1-W5.1-P3.70-LS6.5-TL_H1.5]  112.27 33.78 180 top
TV1  SRV05-4-P-T7  [SOT-23-6_L2.9-W1.6-P0.95-LS2.8-BR]  168.25 10.36 90 top
U1  ESP32-WROOM-32E-N4  [WIFI-SMD_ESP32-WROOM-32E]  110.74 10.16 90 top
U2  HLK-5M05  [PWRM-TH_HLK-5M05]  67.75 14.85 0 top
U3  AMS1117-3.3  [SOT-223-3_L6.5-W3.4-P2.30-LS7.0-BR]  93.98 16.76 180 top
U5  CH340C  [SOP-16_L10.0-W3.9-P1.27-LS6.0-BL]  158.75 9.14 90 top
U6  PCF8563TS/5,118  [TSSOP-8_L3.0-W3.0-P0.65-LS4.9-BL]  134.36 11.51 0 top
USBC1  TYPE-C-31-M-12  [USB-C_SMD-TYPE-C-31-M-12]  175.82 10.41 90 top
X1  32.768kHz  [FC-135R_L3.2-W1.5]  133.6 6.71 0 top

## Footprints (pads in the part's own frame, mm; a bottom-side part is the same pattern mirrored in y, then rotated)
BAT-SMD_CR2032-3V
  rect 3x3 smd: 1(0,11.9) 1(0,-11.9)
  round 14 smd: 2(0,0.127)
C0603
  rect 0.8x0.9 smd: 1(-0.7,0) 2(0.7,0)
CAP-TH_L13.0-W6.0-P10.00-D1.0
  round 2 hole 1.3: 1(-5.08,0) 2(5.08,0)
CASE-B_3528
  rect 1.506x2.376 smd: 1(-1.861,0) 2(1.861,0)
CONN-TH_2P-P5.08_DIBO_DB142R-5.08-2P
  round 2.3 hole 1.5: 1(-2.54,3.81) 1(-2.54,-3.81) 2(2.54,3.81) 2(2.54,-3.81)
CONN-TH_3P-P2.54_DIBO_DB141V-2.54-3P
  round 1.7 hole 1.2: 1(-2.54,2.54) 1(-2.54,-2.54) 2(0,2.54) 2(0,-2.54) 3(2.54,2.54) 3(2.54,-2.54)
F1206
  rect 1.19x1.728 smd: 1(-1.445,0) 2(1.445,0)
F2410
  rect 2x3.2 smd: 1(-2.5,0) 2(2.5,0)
FC-135R_L3.2-W1.5
  rect 1x1.8 smd: 1(-1.25,0) 2(1.25,0)
FUSE-SMD_L6.1-W2.6
  rect 2.91x2.91 smd: 1(-2.33,0) 2(2.33,0)
HDR-TH_4P-P2.54-V-F
  rect 1.7x1.7 hole 1.1: 1(-3.81,0)
  round 1.7 hole 1.1: 2(-1.27,0) 3(1.27,0) 4(3.81,0)
LED0603-R-RD_WHITE
  rect 0.8x0.8 smd: 1(0.8,0) 2(-0.8,0)
LED0603-RD
  rect 0.8x0.8 smd: 1(-0.799,0) 2(0.799,0)
Pad_e74
  round 3.2 hole 3.2: (0,0)
Pad_e85
  round 3.2 hole 3.2: (0,0)
Pad_e1177
  round 3.2 hole 3.2: (0,0)
PWRM-TH_HLK-5M05
  round 2 hole 1.2: 1(-16.8,3) 2(-16.8,-3) 3(16.8,9) 4(16.8,-9)
R0603
  rect 0.806x0.864 smd: 1(-0.753,0) 2(0.753,0)
RELAY-TH_PANASONIC_APAN31XX
  round 1.6 hole 1: 1(8.889,0) 2(6.351,0)
  round 1.8 hole 1.2: 5(-3.809,0) 6(-8.889,0)
RES-TH_L13.0-W6.0-P7.50-D0.9-S6.00
  round 1.8 hole 1: 1(-3.75,3) 2(3.75,-3)
SOD-123_L2.7-W1.6-LS3.7-RD-1
  rect 1.2x0.95 smd: 1(-1.7,0) 2(1.7,0)
SOD-123F_L2.7-W1.6-LS3.8-RD
  rect 1.1x1 smd: 1(-1.735,0) 2(1.735,0)
SOP-16_L10.0-W3.9-P1.27-LS6.0-BL
  oval 0.56x1.745 smd: 1(-4.445,-2.873) 2(-3.175,-2.873) 3(-1.905,-2.873) 4(-0.635,-2.873) 5(0.635,-2.873) 6(1.905,-2.873) 7(3.175,-2.873) 8(4.445,-2.873) 9(4.445,2.873) 10(3.175,2.873) 11(1.905,2.873) 12(0.635,2.873) 13(-0.635,2.873) 14(-1.905,2.873) 15(-3.175,2.873) 16(-4.445,2.873)
SOT-23-3_L2.9-W1.6-P1.90-LS2.8-BR
  rect 1.07x0.6 smd: 1(1.235,-0.95) 2(1.235,0.95) 3(-1.235,0)
SOT-23-6_L2.9-W1.6-P0.95-LS2.8-BR
  rect 1.1x0.6 smd: 1(1.35,-0.95) 2(1.35,0) 3(1.35,0.95) 4(-1.35,0.95) 5(-1.35,0) 6(-1.35,-0.95)
SOT-223-3_L6.5-W3.4-P2.30-LS7.0-BR
  rect 2.5x1.1 smd: 1(2.97,-2.3) 2(2.97,0) 3(2.97,2.3)
  rect 2.34x3.6 smd: 4(-2.97,0)
SW-SMD_4P-L5.1-W5.1-P3.70-LS6.5-TL_H1.5
  rect 1x0.75 smd: 1(-3,1.875) 2(3,1.875) 3(-3,-1.875) 4(3,-1.875)
TSSOP-8_L3.0-W3.0-P0.65-LS4.9-BL
  oval 0.37x1.35 smd: 1(-0.975,-2.22) 2(-0.325,-2.22) 3(0.325,-2.22) 4(0.975,-2.22) 5(0.975,2.22) 6(0.325,2.22) 7(-0.325,2.22) 8(-0.975,2.22)
USB-C_SMD-TYPE-C-31-M-12
  oval 1.2x2 hole 0.8x1.6: 0(-4.325,1.706) 1(4.325,1.706)
  oval 1.2x1.8 hole 0.8x1.4: 2(4.325,-2.474) 3(-4.325,-2.474)
  rect 0.3x1.3 smd: A1(-3.35,2.474) A4(-2.55,2.474) A5(-1.25,2.474) A6(-0.25,2.474) A7(0.25,2.474) A8(1.25,2.474) A9(2.55,2.474) A12(3.35,2.474) B1(3.05,2.474) B4(2.25,2.474) B5(1.75,2.474) B6(0.75,2.474) B7(-0.75,2.474) B8(-1.75,2.474) B9(-2.25,2.474) B12(-3.05,2.474)
WIFI-SMD_ESP32-WROOM-32E
  rect 0.95x2.1 smd: 1(-9.002,-9) 2(-7.732,-9) 3(-6.463,-9) 4(-5.192,-9) 5(-3.922,-9) 6(-2.652,-9) 7(-1.383,-9) 8(-0.113,-9) 9(1.157,-9) 10(2.428,-9) 11(3.697,-9) 12(4.968,-9) 13(6.237,-9) 14(7.508,-9) 25(7.508,9) 26(6.237,9) 27(4.968,9) 28(3.697,9) 29(2.428,9) 30(1.157,9) 31(-0.113,9) 32(-1.383,9) 33(-2.652,9) 34(-3.922,9) 35(-5.192,9) 36(-6.463,9) 37(-7.732,9) 38(-9.002,9)
  rect 2.1x0.95 smd: 15(9.002,-5.715) 16(9.002,-4.445) 17(9.002,-3.175) 18(9.002,-1.905) 19(9.002,-0.635) 20(9.002,0.635) 21(9.002,1.905) 22(9.002,3.175) 23(9.002,4.445) 24(9.002,5.715)
  rect 0.9x0.9 smd: 39(-2.721,-0.1) 39(-2.721,-1.5) 39(-2.721,-2.9) 39(-1.321,-0.1) 39(-1.321,-1.5) 39(-1.321,-2.9) 39(0.079,-0.1) 39(0.079,-1.5) 39(0.079,-2.9)

## Nets
As in the schematic, except:
BAT+: D3.2

Pads without a net: BT1 1; SW1 2 4; U1 4 5 6 9 10 11 13 14 16 17 18 19 20 21 22 23 24 26 27 28 29 30 31 32 37; U5 7 8 9 10 11 12 15; U6 3 7; USBC1 A8 B8

## Via types
v1: diameter 0.61, hole 0.305, Top Layer to Bottom Layer, 169 vias

## Routing (per net, layer and track width the routed paths; a pad name or vN(x,y) marks a point on that pad's centre or on a via; arc(x,y) is an arc through that point)
+3V3: length 59.5
  Top Layer w0.6: R4.2 v1(149.86,1.91) ; R8.2 97.54,3.56 v1(96.52,3.56) ; v1(97.28,24.89) 97.28,24.47 C4.1 ; v1(168.28,8) 168.28,8.99 TV1.5 ; v1(116.21,35.69) 116.18,35.66 SW1.3 ; U5.16 155.88,2.93 156.02,2.79 154.94,2.79 v1(154.81,2.67) ; v1(95.38,17.07) v1(95.38,15.75) ; R7.2 v1(99.01,10.27) ; v1(96.02,23.37) v1(96.02,21.34) 96.02,21.34 C5.2 ; v1(96.02,23.37) 97.71,23.37 C4.1 ; v1(96.02,23.37) C8.2 ; 161.62,8.51 162.43,8.51 163.13,7.81 C12.1 165.04,7.81 v1(165.1,7.87) ; v1(147.83,10.92) 147.76,10.99 146.8,10.99 ; D4.2 v1(137.8,18.03) ; C4.1 98.78,24.44 v1(98.78,24.89) 100.55,24.89 LED2.1 ; U3.2 v1(92.61,16.76) ; U3.4 95.43,18.29 v1(95.38,18.29)
  Top Layer w1: C15.1 166.88,26.8 ; 166.88,26.8 v1(166.37,26.8) ; 166.88,26.8 v1(167.43,26.8) 176.91,26.8 CN1.2 ; 166.88,26.8 R16.2 ; v1(125.34,2.48) 125.29,2.43 U1.2 119.73,2.41 v1(118.24,2.41) v1(117.42,2.41)
  Top Layer w1.8: 95,17.65 95,19.56 95.38,19.94 95.38,22.86
  Top Layer w2: v1(92.61,16.76) 95,16.76
  vias: v1(121.1,2.41) v1(123.2,2.41) v1(162.79,8.19)
+5V: length 186.1
  Top Layer w0.508: D2.1 61.6,28.18 K1.2
  Top Layer w1: v1(93.73,13.46) 92.01,13.46 ; 163.7,18.18 v1(163.7,13.08) ; v1(128.12,22.35) v1(128.12,28.45)
  Top Layer w1.2: U3.3 91.54,13.94 ; C9.2 C6.2 92.26,13.21 92,13.47
  Top Layer w1.6: 91.44,13.84 91.44,9.02 92.2,8.25 C2.1
  Top Layer w2: C2.1 91.52,7.11 85.82,7.11 U2.4
  Bottom Layer w1: v1(93.73,13.46) 94.62,14.35 119.13,14.35 127.13,22.35 v1(128.12,22.35) 129.29,22.35 130.43,21.21 130.43,15.24 ; v1(128.12,28.45) 127.49,27.81 62.99,27.81 61.6,29.21 K1.2 ; v1(163.7,13.08) 132.21,13.08 130.24,15.05
GND:
  vias: v1(75.67,35.92) v1(75.67,30.84) v1(80.75,35.92) v1(80.75,30.84) v1(85.83,35.92) v1(85.83,30.84) v1(85.83,25.76) v1(85.83,20.68) v1(85.83,15.6) v1(85.83,10.52) v1(88.39,10.99) v1(88.39,3.72) v1(90.91,35.92) v1(90.91,30.84) v1(90.91,25.76) v1(90.91,20.68) v1(92.49,23.37) v1(92.49,21.34) v1(94.87,12.06) v1(94.87,9.87) v1(95.99,35.92) v1(95.99,30.84) v1(95.99,25.76) v1(95.99,10.52) v1(95.99,5.44) v1(97.41,21.08) v1(98.3,21.08) v1(99.7,20.45) v1(99.7,19.74) v1(100.08,1.14) v1(101.07,35.92) v1(101.07,30.84) v1(101.07,20.68) v1(103.25,1.14) v1(104.21,1.14) v1(106.15,35.92) v1(106.15,30.84) v1(106.15,25.76) v1(106.15,15.6) v1(106.15,10.52) v1(107.8,1.14) v1(109.6,10.45) v1(109.6,7.49) v1(109.86,8.89) v1(110.23,1.14) v1(110.74,6.48) v1(111.23,35.92) v1(111.23,30.84) v1(111.23,25.76) v1(111.23,15.6) v1(111.63,8.13) v1(112.25,6.48) v1(112.99,8.13) v1(113.33,1.14) v1(113.87,6.48) v1(114.68,10.29) v1(114.81,8.76) v1(114.81,7.32) v1(115.98,1.14) v1(116.31,25.76) v1(116.31,20.68) v1(116.31,15.6) v1(116.31,10.52) v1(117.37,1.14) v1(118.24,1.14) v1(121.39,35.92) v1(121.39,30.84) v1(123.19,1.14) v1(125.24,1.1) v1(126.47,35.92) v1(126.47,30.84) v1(126.47,25.76) v1(126.47,15.6) v1(126.47,10.52) v1(131.55,35.92) v1(131.55,30.84) v1(131.55,25.76) v1(131.55,10.52) v1(136.63,35.92) v1(136.63,30.84) v1(136.63,25.76) v1(136.63,20.68) v1(136.63,15.6) v1(136.63,10.52) v1(141.71,35.92) v1(141.71,30.84) v1(141.71,15.6) v1(141.71,10.52) v1(146.79,35.92) v1(146.79,30.84) v1(146.79,15.6) v1(148.34,23) v1(151.87,35.92) v1(151.87,30.84) v1(151.87,15.6) v1(151.87,10.52) v1(156.95,35.92) v1(156.95,30.84) v1(156.95,25.76) v1(156.95,20.68) v1(156.95,15.6) v1(162.03,35.92) v1(162.03,30.84) v1(162.03,25.76) v1(162.03,20.68) v1(162.03,15.6) v1(167.11,35.92) v1(167.11,30.84) v1(167.11,20.68) v1(167.11,5.44) v1(167.25,13.46) v1(167.28,6.3) v1(172.19,35.92) v1(172.19,20.68) v1(172.19,15.6) v1(172.19,5.44) v1(177.27,35.92) v1(177.27,20.68) v1(177.27,10.52)
VBUS: length 13.6
  Top Layer w0.6: 172.67,12.8 172.11,12.8 v1(171.7,13.21)
  Top Layer w0.7: 171.96,7.82 172.15,8.01 172.48,8.01
  Top Layer w1: v1(171.7,13.21) 171.7,14.09 F2.1 ; v1(171.65,6.91) 171.65,7.52 171.96,7.82
  Bottom Layer w1: v1(171.65,6.91) 173.28,8.53 173.28,11.63 v1(171.7,13.21)
BAT+: length 8.1
  Top Layer w0.6: D3.2 131.57,21.84 133.1,23.37 136.44,23.37
DN: length 17.2
  Top Layer w0.254: 172.04,10.66 162.01,10.66 U5.6 ; 172.04,10.66 172.04,11.09 v1(172.01,11.12) ; 172.04,10.66 USBC1.A7 ; v1(171.25,9.58) 171.33,9.66 USBC1.B7
  Top Layer w0.508: TV1.1 169.2,10.87
  Bottom Layer w0.254: v1(172.01,11.12) 172.01,10.34 v1(171.25,9.58)
DP: length 16.3
  Top Layer w0.254: USBC1.B6 174.51,11.16 174.65,11.02 174.65,10.41 174.4,10.16 USBC1.A6 162.01,10.16 U5.5
  Top Layer w0.508: TV1.6 169.2,9.99 169.22,10.01
ESP32_EN: length 38.7
  Top Layer w0.254: v1(146.05,3.96) 146.6,4.51 C10.2 149.86,4.51 R4.1 151.65,6.31 151.65,7.87 ; U1.3 117.79,3.7 v1(117.7,3.61)
  Bottom Layer w0.254: v1(117.7,3.61) 118.06,3.96 v1(146.05,3.96)
ESP32_IO0: length 55.1
  Top Layer w0.254: U1.25 101.78,17.63 103.3,17.63 103.48,17.45 v1(103.48,9.69) ; Q2.3 144.53,7.87 144.53,9.14 145.04,9.66 145.04,9.91 v1(145.08,9.94) 145.08,11.1 145,11.18
  Bottom Layer w0.254: v1(145.08,9.94) 144.82,9.69 v1(103.48,9.69)
ESP32_RX: length 61.1
  Top Layer w0.254: v1(103.28,6.25) 101.75,6.25 U1.34 ; v1(158.5,6.91) 159.44,5.97 U5.2
  Bottom Layer w0.254: v1(158.5,6.91) 157.23,5.64 103.89,5.64 v1(103.28,6.25)
ESP32_TX: length 60.8
  Top Layer w0.254: v1(103.38,4.98) 101.75,4.98 U1.35 ; U5.3 161.6,7.21 v1(160.12,7.21)
  Bottom Layer w0.254: v1(160.12,7.21) 157.89,4.98 v1(103.38,4.98)
ESP_RLY: length 68.9
  Top Layer w0.508: U1.12 121.2,15.13 ; 121.2,15.13 122.28,15.13 LED3.2 ; 121.2,15.13 v1(121.2,29.67) ; Q3.1 73.1,31.44 R6.2 73.2,31.47 v1(73.2,29.92)
  Bottom Layer w0.508: v1(73.2,29.92) 73.46,29.67 v1(121.2,29.67)
L: length 48.7
  Top Layer w1.8: K1.5 51.44,27.05 49.28,24.89 44.24,24.89 44.2,24.85 43.9,25.15 C1.1 33.02,25.15 31.94,24.07 R1.2 29.86,25.15 18.03,25.15 CN4.2 CN4.2
L_SW: length 41.7
  Top Layer w1.8: K1.6 42.67,34.29 19.05,34.29 CN4.1 14.73,33.53 10.41,33.53 8.89,32 CN4.1
N: length 32.9
  Top Layer w1.8: U2.2 42,11.85 38.86,14.99 C1.2 36.07,14.73 25.91,14.73 ; R1.1 25.65,15.86 25.65,10.46
ONEWIRE: length 74.8
  Top Layer w0.254: v1(122.33,8.48) 122.33,9.3 121.56,10.06 119.75,10.06 U1.8
  Top Layer w0.508: v1(166.06,9.09) 167.22,9.09 TV1.4 ; CN1.3 176.79,24.14 R16.1 165.81,23.07 v1(165.81,22.86)
  Bottom Layer w0.254: v1(166.06,9.09) 122.94,9.09 v1(122.33,8.48)
  Bottom Layer w0.508: v1(165.81,22.86) 165.81,9.35 v1(166.06,9.09)
SCL: length 46.1
  Top Layer w0.254: H1.3 130.5,14.02 132.13,12.39 134.42,12.39 134.68,12.66 U6.6 ; 99.1,3.61 101.65,3.61 U1.36 101.78,3.66 103.89,3.66 105.11,4.88 v1(105.11,12.29)
  Bottom Layer w0.254: v1(105.11,12.29) 126.29,12.29 H1.3
SDA: length 41.9
  Top Layer w0.254: v1(104.34,11.53) 104.34,8.18 103.63,7.47 101.78,7.47 U1.33 101.57,7.68 R7.1 ; H1.4 128.07,11.53 134.72,11.53 135.33,12.14 U6.5
  Bottom Layer w0.254: v1(104.34,11.53) 104.39,11.48 H1.4
$1N2483: length 27
  Top Layer w0.254: SW1.1 115.32,31.85 R14.2 116.99,31.69 116.99,30.17 118.01,29.16 118.01,9.09 118.32,8.78 U1.7
$1N2665: length 1.8
  Top Layer w0.508: R15.2 123.99,16.97 LED3.1
$2N1901: length 8.3
  Top Layer w0.508: Q3.3 66.98,30.61 K1.1 64.83,29.91 D2.2
$2N2254: length 1.9
  Top Layer w0.6: LED2.2 R13.2
$2N4343: length 29.8
  Top Layer w1.8: 17.32,5.8 16.51,6.6 CN5.2 CN5.1 CN5.1 CN5.2 ; 17.53,5.8 25.65,5.8
$2N4365: length 7.6
  Top Layer w1.8: 44.2,19.85 46,18.05 50.75,18.05 U2.1
$3N1120: length 7.7
  Top Layer w0.6: F2.2 165.86,14.45 165.86,13.15 TV1.3
  Top Layer w1.2: 167,18.19 167.16,18.03 F2.2
$3N1265: length 4.3
  Top Layer w0.254: USBC1.B5 170.87,12.16 169.61,13.42 R3.2
$3N1271: length 5
  Top Layer w0.254: R2.1 169.87,6.99 172.04,9.16 USBC1.A5
$3N1441: length 9.3
  Top Layer w0.254: Q2.2 152.85,8.82 153.16,8.51 155.88,8.51
$3N1446: length 9.4
  Top Layer w0.254: U5.14 155.45,6.81 v1(152.45,6.81) ; Q2.1 149.18,6.92 149.3,6.81 v1(150.59,6.81)
  Bottom Layer w0.254: v1(152.45,6.81) v1(150.59,6.81)
$4N445: length 2.9
  Top Layer w0.254: X1.2 134.03,7.53 U6.2
$4N449: length 4.9
  Top Layer w0.254: C16.2 132.29,6.64 X1.1 133.38,7.73 U6.1
$4N609: length 6.9
  Top Layer w0.254: 133.4,15.75 133.4,18.02 D4.1 ; 133.4,15.75 C17.1 133.38,15.21 U6.8 ; 133.4,15.75 131.62,15.75 D3.1

## Copper pours and planes (outline as drawn; the poured copper is in the pictures)
+3V3 on Inner2: 70.49,37.85 70.49,28.7 82.3,28.7 82.3,0 180.09,0 180.09,37.85
GND on Top Layer: 70.49,37.85 70.49,28.7 82.3,28.7 82.3,0 180.09,0 180.09,37.85
GND on Inner1: 70.49,37.85 70.49,28.7 82.3,28.7 82.3,0 180.09,0 180.09,37.85

## Text on the board
Top Silkscreen Layer: GND | N | CR2032 | L | L_SW | 4A | 500mA | +3V3 | 1WIRE | github.com/mmame/CirculationPumpSmartControl | 20250317
